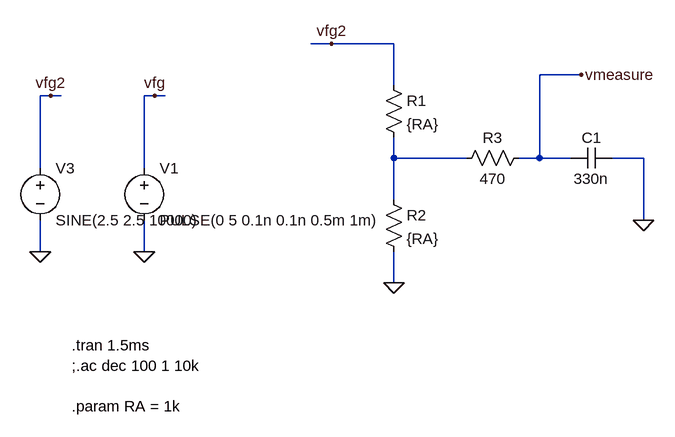
[diagram p0: schematic hardware1.asc]
hardware1.asc, the LTspice schematic file:
Version 4.1
SHEET 1 996 680
WIRE 480 -80 448 -80
WIRE 576 -80 480 -80
WIRE 864 -32 800 -32
WIRE 576 -16 576 -80
WIRE 48 0 32 0
WIRE 64 0 48 0
WIRE 208 0 192 0
WIRE 224 0 208 0
WIRE 576 96 576 64
WIRE 688 96 576 96
WIRE 800 96 800 -32
WIRE 800 96 768 96
WIRE 848 96 800 96
WIRE 960 96 912 96
WIRE 32 112 32 0
WIRE 192 112 192 0
WIRE 576 160 576 96
WIRE 960 192 960 96
WIRE 32 240 32 192
WIRE 192 240 192 192
WIRE 576 288 576 240
FLAG 32 240 0
FLAG 192 240 0
FLAG 576 288 0
FLAG 960 192 0
FLAG 48 0 vfg2
FLAG 208 0 vfg
FLAG 480 -80 vfg2
FLAG 864 -32 vmeasure
SYMBOL voltage 32 96 R0
SYMATTR InstName V3
SYMATTR Value SINE(2.5 2.5 10000)
SYMBOL voltage 192 96 R0
SYMATTR InstName V1
SYMATTR Value PULSE(0 5 0.1n 0.1n 0.5m 1m)
SYMBOL res 560 -32 R0
SYMATTR InstName R1
SYMATTR Value {RA}
SYMBOL res 560 144 R0
SYMATTR InstName R2
SYMATTR Value {RA}
SYMBOL res 784 80 R90
WINDOW 0 0 56 VBottom 2
WINDOW 3 32 56 VTop 2
SYMATTR InstName R3
SYMATTR Value 470
SYMBOL cap 912 80 R90
WINDOW 0 0 32 VBottom 2
WINDOW 3 32 32 VTop 2
SYMATTR InstName C1
SYMATTR Value 330n
TEXT 80 384 Left 2 !.tran 1.5ms\n;.ac dec 100 1 10k\n \n.param RA = 1k

The netlist it stands for:
* hardware1.asc
V3 vfg2 0 SINE(2.5 2.5 10000)
V1 vfg 0 PULSE(0 5 0.1n 0.1n 0.5m 1m)
R1 vfg2 N001 {RA}
R2 N001 0 {RA}
R3 vmeasure N001 470
C1 0 vmeasure 330n
.tran 1.5ms
;.ac dec 100 1 10k
.param RA = 1k
.backanno
.end

* Results of the author's LTspice run, read from the files saved beside the schematic
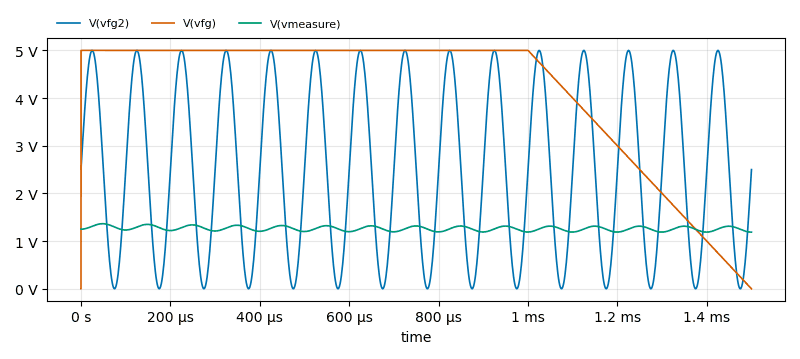
[diagram p1: Transient Analysis of hardware1.asc, plotted from the saved traces]
* Transient Analysis, 1 run:
*   V(vfg2): min 38.48 µV, max 5 V, average 2.5 V, rms 3.062 V, last 2.5 V
*   V(vfg): min 0 V, max 5 V, average 4.167 V, rms 4.41 V, last 2 µV
*   V(vmeasure): min 1.189 V, max 1.365 V, average 1.263 V, rms 1.264 V, last 1.189 V